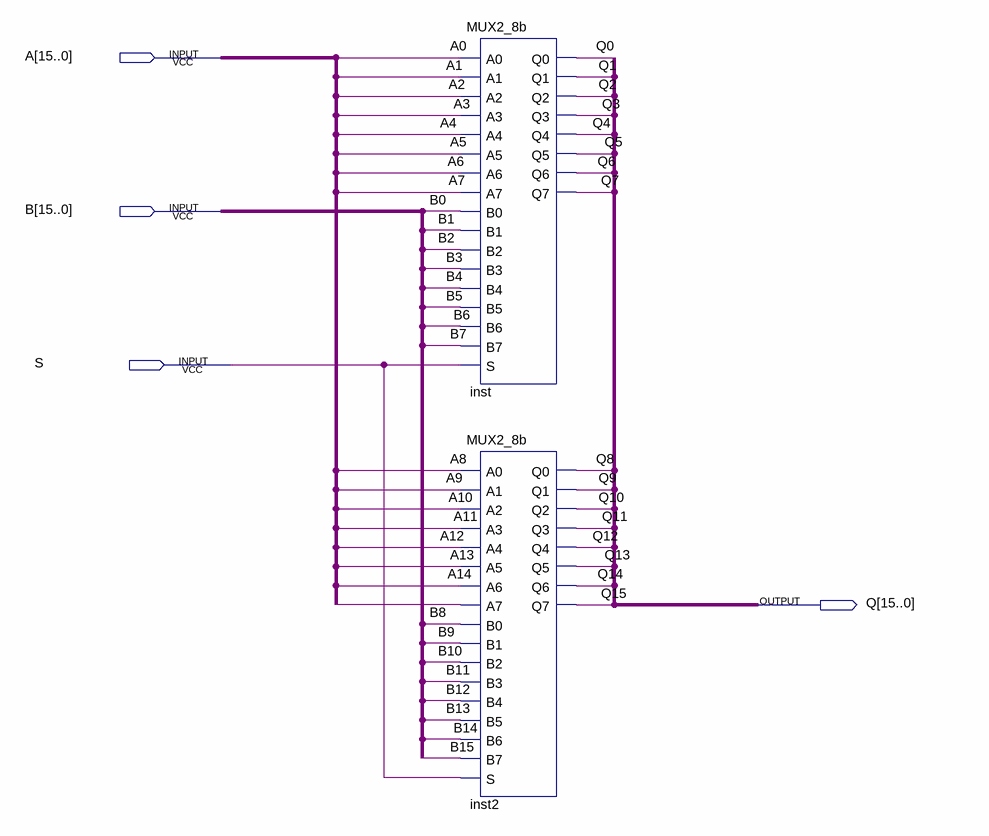
[diagram p0: schematic sheet]
// Quartus schematic MUX2_16b.bdf as structural Verilog: 2 symbols, 4 pins
module MUX2_16b (
  input  [15:0] A,
  input  [15:0] B,
  input  S,
  output [15:0] Q
);

  wire undriven;

  MUX2_8b inst (
    .A0(A[0]), .A1(A[1]), .A2(A[2]), .A3(A[3]), .A4(A[4]), .A5(A[5]), .A6(A[6]), .A7(A[7]), .B0(B[0]),
    .B1(B[1]), .B2(B[2]), .B3(B[3]), .B4(B[4]), .B5(B[5]), .B6(B[6]), .B7(B[7]), .S(S), .Q0(Q[0]), .Q1(Q[1]),
    .Q2(Q[2]), .Q3(Q[3]), .Q4(Q[4]), .Q5(Q[5]), .Q6(Q[6]), .Q7(Q[7]));
  MUX2_8b inst2 (
    .A0(A[8]), .A1(A[9]), .A2(A[10]), .A3(A[11]), .A4(A[12]), .A5(A[13]), .A6(A[14]), .A7(undriven),
    .B0(B[8]), .B1(B[9]), .B2(B[10]), .B3(B[11]), .B4(B[12]), .B5(B[13]), .B6(B[14]), .B7(B[15]), .S(S),
    .Q0(Q[8]), .Q1(Q[9]), .Q2(Q[10]), .Q3(Q[11]), .Q4(Q[12]), .Q5(Q[13]), .Q6(Q[14]), .Q7(Q[15]));
endmodule
